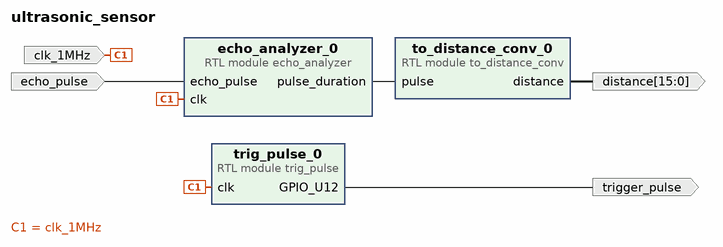
[diagram p0: block diagram of the top level]
# Vivado block design ultrasonic_sensor, xc7z020clg400-1, Vivado 2023.1
create_bd_design ultrasonic_sensor

create_bd_port -dir I -type clk clk_1MHz
set_property -dict {CONFIG.FREQ_HZ 100000000} [get_bd_ports clk_1MHz]
create_bd_port -dir I echo_pulse
create_bd_port -dir O -from 15 -to 0 distance
create_bd_port -dir O trigger_pulse

create_bd_cell -type module -reference echo_analyzer echo_analyzer_0
create_bd_cell -type module -reference to_distance_conv to_distance_conv_0
create_bd_cell -type module -reference trig_pulse trig_pulse_0

# ---- connections ----

connect_bd_net [get_bd_ports clk_1MHz] [get_bd_pins echo_analyzer_0/clk] [get_bd_pins trig_pulse_0/clk]
connect_bd_net [get_bd_pins echo_analyzer_0/pulse_duration] [get_bd_pins to_distance_conv_0/pulse]
connect_bd_net [get_bd_ports echo_pulse] [get_bd_pins echo_analyzer_0/echo_pulse]
connect_bd_net [get_bd_pins to_distance_conv_0/distance] [get_bd_ports distance]
connect_bd_net [get_bd_pins trig_pulse_0/GPIO_U12] [get_bd_ports trigger_pulse]

validate_bd_design
save_bd_design
